# Altium schematic sheet Connector_Section.SchDoc
size A4; DocumentNumber: 5; SheetNumber: 5
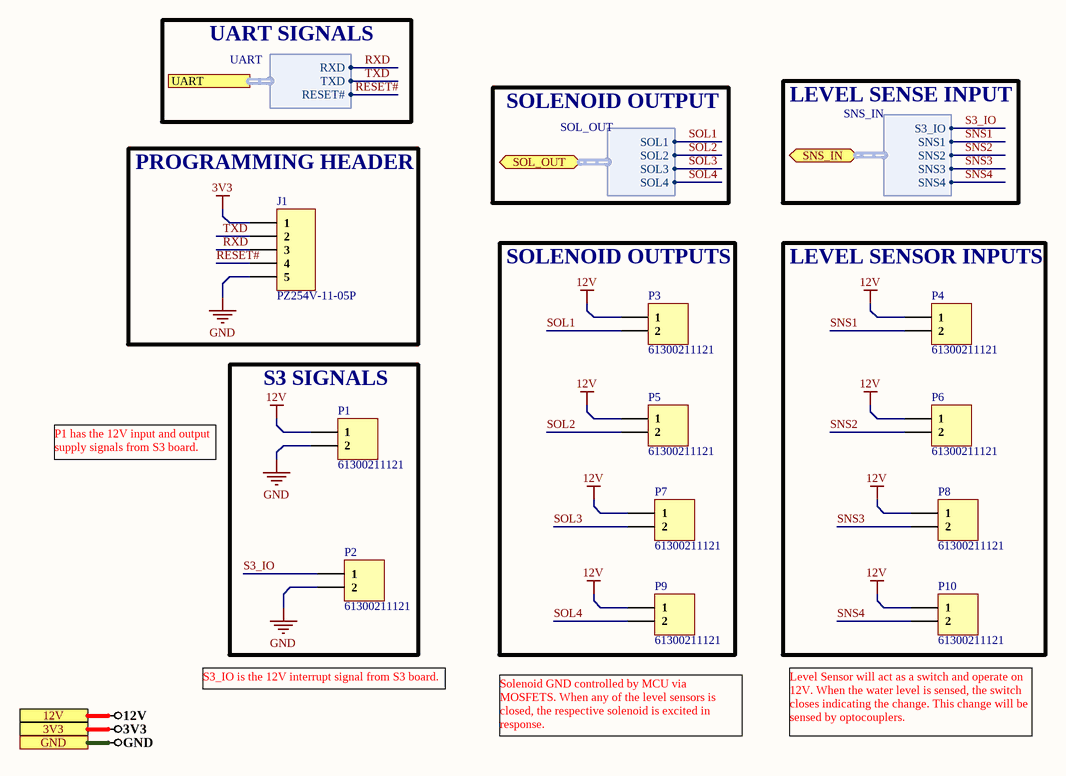
[diagram p0: Connector_Section.SchDoc]

## Parts
J1  PZ254V-11-05P  [HDR1X5]
P1  61300211121  [HDR1X2]
P2  61300211121  [HDR1X2]
P3  61300211121  [HDR1X2]
P4  61300211121  [HDR1X2]
P5  61300211121  [HDR1X2]
P6  61300211121  [HDR1X2]
P7  61300211121  [HDR1X2]
P8  61300211121  [HDR1X2]
P9  61300211121  [HDR1X2]
P10  61300211121  [HDR1X2]

## Blocks framed on the sheet
PROGRAMMING HEADER: J1
SOLENOID OUTPUTS: P3 P5 P7 P9
LEVEL SENSOR INPUTS: P4 P6 P8 P10
S3 SIGNALS: P1 P2

## Ports
3V3, 12V, GND, SNS_IN (bidir, harness SNS_IN), SOL_OUT (bidir, harness SOL_OUT), UART (harness UART)

## Harnesses
SNS_IN: S3_IO, SNS1, SNS2, SNS3, SNS4
SOL_OUT: SOL1, SOL2, SOL3, SOL4
UART: RXD, TXD, RESET#

## Nets
3V3: J1.1 ; port 3V3
12V: P1.1 P3.1 P4.1 P5.1 P6.1 P7.1 P8.1 P9.1 P10.1 ; port 12V
GND: J1.5 P1.2 P2.2 ; port GND
RESET#: J1.4 ; port UART.RESET#
RXD: J1.3 ; port UART.RXD
S3_IO: P2.1 ; port SNS_IN.S3_IO
SNS1: P4.2 ; port SNS_IN.SNS1
SNS2: P6.2 ; port SNS_IN.SNS2
SNS3: P8.2 ; port SNS_IN.SNS3
SNS4: P10.2 ; port SNS_IN.SNS4
SOL1: P3.2 ; port SOL_OUT.SOL1
SOL2: P5.2 ; port SOL_OUT.SOL2
SOL3: P7.2 ; port SOL_OUT.SOL3
SOL4: P9.2 ; port SOL_OUT.SOL4
TXD: J1.2 ; port UART.TXD

## Notes on the sheet
- UART SIGNALS
- SOLENOID OUTPUT
- LEVEL SENSE INPUT
- P1 has the 12V input and output supply signals from S3 board.
- S3_IO is the 12V interrupt signal from S3 board.
- Solenoid GND controlled by MCU via MOSFETS. When any of the level sensors is closed, the respective solenoid is excited in response.
- (near P10) Level Sensor will act as a switch and operate on 12V. When the water level is sensed, the switch closes indicating the change. This change will be sensed by optocouplers.

## Library data of the parts
J1 = PZ254V-11-05P: Pin Header 5 1 right-angle; Manufacturer: XFCN; Brand Category: Made In Asia Brands; Pitch: 2.54; Packaging: Bag-packed; Connector Type: Pin Header; Number of Pins: 5; Number of Rows: 1
P1-P10 = Header 1x2: CONN HEADER VERT 2POS 2.54MM; Manufacturer: Wurth Electronics; Current Rating: 3A; Voltage Rating: 250V; Number of Positions: 2; Gender: Male; Connector Type: Male Pin; Pitch: 0.1inch; Supplier 1: Digi-Key; Manufacturer Part Number: 61300211121; Stock 1: 219205; Pricing 1: 1=0.13, 10=0.106, 25=0.088, 50=0.074, 100=0.067, 1000=0.061 (USD); Mount: Through Hole; Contact Plating: Gold; Housing Material: PBT; Contact Material: Copper Alloy,Copper; Color: Black; Min Operating Temperature: -40°C; Max Operating Temperature: 125°C; Number of Rows: 1; Contact Gender: Male; Packaging: Bulk; Termination: Through Hole; Number of Contacts: 2; Contact Mating Length: 0.236inch; REACH SVHC: Unknown; Lead Free: Lead Free; ComponentLink1URL: http://www.mouser.com/ds/2/445/6130xx11121-538006.pdf?src-supplier=Mouser; ComponentLink1Description: http://www.mouser.com/ds/2/445/6130xx11121-538006.pdf?src-supplier=Mouser; Supplier Part Number 1: 732-5315-ND